# Altium schematic sheet MSP-LITO-MSPM0L2228.SchDoc: MSPM0G3507
size 431 x 279 mm; Date: Not shown in title block; ApprovedBy: Not shown in title block; CheckedBy: Not shown in title block; Author: Not shown in title block; CompanyName: Not shown in title block; DrawnBy: Johnson He; Engineer: Not shown in title block; Organization: Not shown in title block; Address1: Not shown in title block; Address2: Not shown in title block; Address3: Not shown in title block; Address4: Not shown in title block; DocumentNumber: 1; Revision: Use project parameter SCH_Rev; SheetNumber: 1; SheetTotal: 1; PageSetup: Record=PageOptions|CenterHorizontal=True|CenterVertical=True|PrintScale=1.00|XCorrection=1.00|YCorrection=1.00|PrintKind=0|BorderSize=5000000|LeftOffset=0|BottomOffset=0|Orientation=2|PaperLength=1000|PaperWidth=1000|Scale=100|PaperSource=15|PrintQuality=600|MediaType=1|DitherType=10|PaperKind=Letter|PrintScaleMode=1; CurrentTime: Not shown in title block; CurrentDate: Not shown in title block; Time: Not shown in title block; DocumentFullPathAndName: Not shown in title block; DocumentName: Not shown in title block; ModifiedDate: Not shown in title block; ImagePath: Not shown in title block
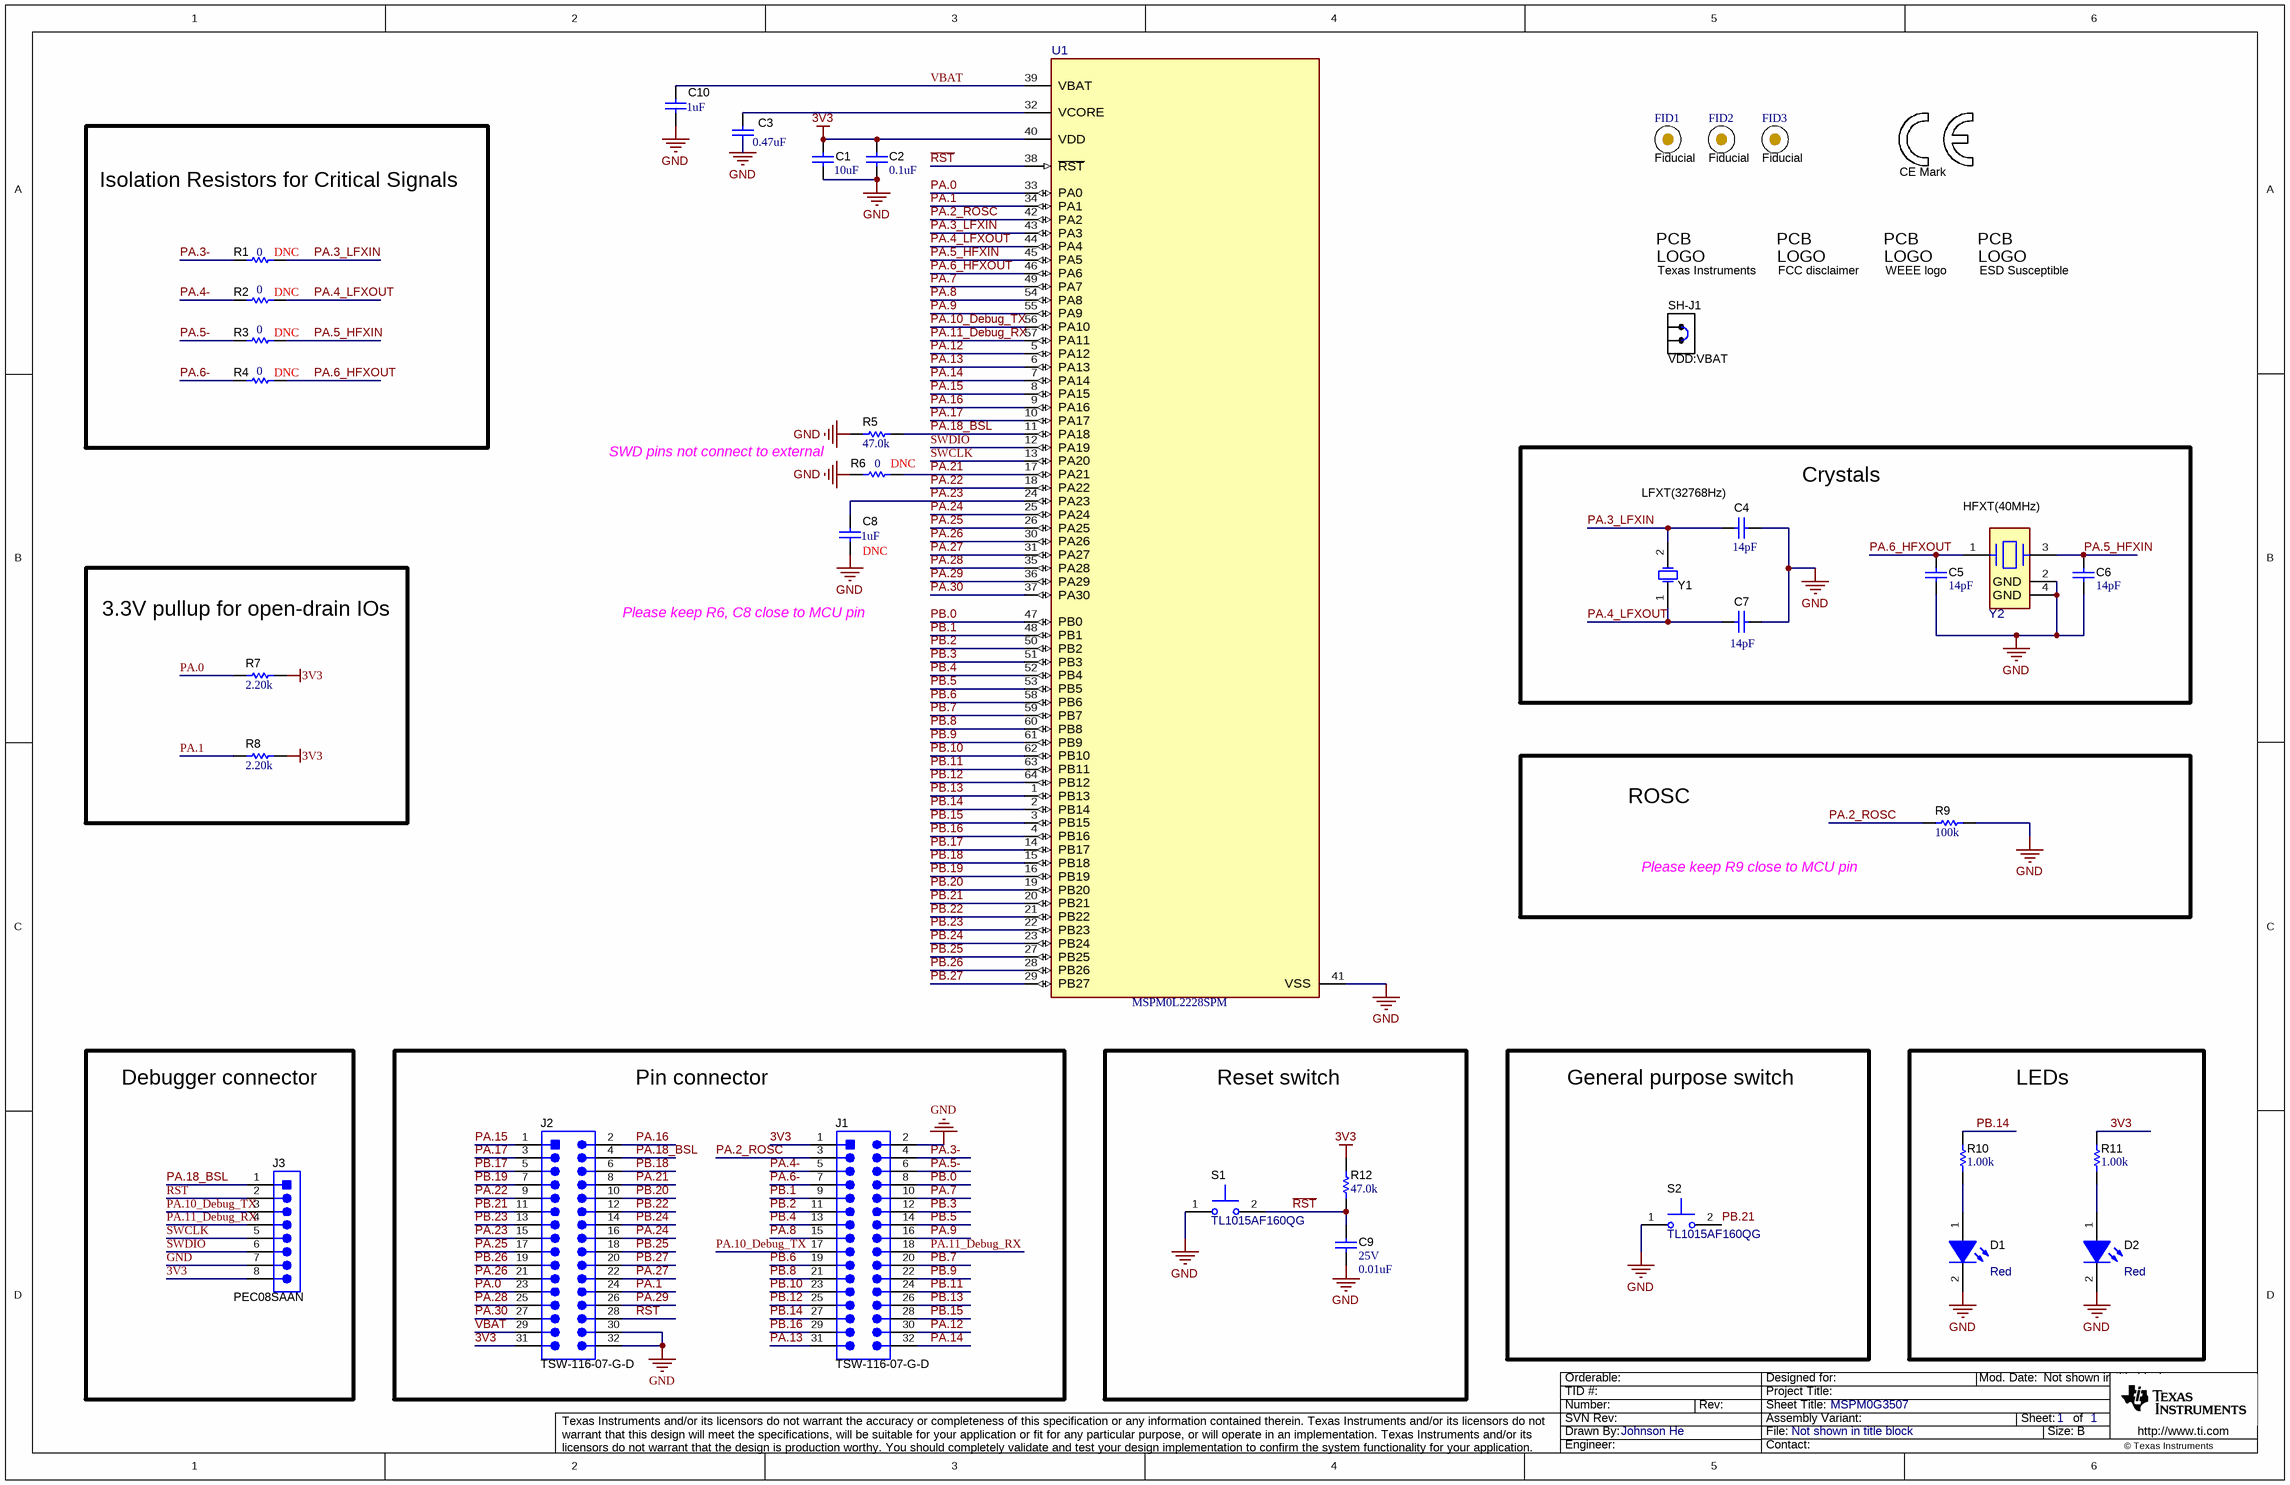
[diagram p0: MSP-LITO-MSPM0L2228.SchDoc]

## Parts
C1  ValueDisplayed: 10uF  [0603]  (hidden comment: GRM188R60J106ME84)
C2  ValueDisplayed: 0.1uF  [0402]  (hidden comment: GRM155R61H104ME14D)
C3  ValueDisplayed: 0.47uF  [0402]  (hidden comment: GRM155R60J474KE19D)
C4  ValueDisplayed: 14pF  [0402]  (hidden comment: GCQ1555C1H140JB01D)
C5  ValueDisplayed: 14pF  [0402]  (hidden comment: GCQ1555C1H140JB01D)
C6  ValueDisplayed: 14pF  [0402]  (hidden comment: GCQ1555C1H140JB01D)
C7  ValueDisplayed: 14pF  [0402]  (hidden comment: GCQ1555C1H140JB01D)
C8  value 1uF  ValueDisplayed: DNC  [0402]  (hidden comment: GRM155R61E105KA12D)
C9  VDC_V: 25V  ValueDisplayed: 0.01uF  [0402]  (hidden comment: GRM155R71E103KA01D)
C10  value 1uF  [0402]  (hidden comment: GRM155R61E105KA12D)
D1  value Red  [LED_SMLD12_RED]  (hidden comment: SML-D12U1WT86)
D2  value Red  [LED_SMLD12_RED]  (hidden comment: SML-D12U1WT86)
FID1  Fiducial  [Fiducial10-20]
FID2  Fiducial  [Fiducial10-20]
FID3  Fiducial  [Fiducial10-20]
J1  TSW-116-07-G-D  [TSW-116-07-G-D]
J2  TSW-116-07-G-D  [TSW-116-07-G-D]
J3  PEC08SAAN  [SULLINS_PEC08SAAN]
Logo1  CE Mark  [CE_Mark_5mm]  (no BOM)
Logo2  Texas Instruments  [TI_Stacked_Overlay_Small]  (no BOM)
Logo3  FCC disclaimer  [FCC_disclaimer]  (no BOM)
Logo4  WEEE logo  [WEEE_Minimum]  (no BOM)
Logo5  ESD Susceptible  [ESD_Overlay_Large]  (no BOM)
R1  value 0  ValueDisplayed: DNC  [0402]  (hidden comment: RC0402JR-070RL)  (no BOM)
R2  value 0  ValueDisplayed: DNC  [0402]  (hidden comment: RC0402JR-070RL)  (no BOM)
R3  value 0  ValueDisplayed: DNC  [0402]  (hidden comment: RC0402JR-070RL)  (no BOM)
R4  value 0  ValueDisplayed: DNC  [0402]  (hidden comment: RC0402JR-070RL)  (no BOM)
R5  ValueDisplayed: 47.0k  [0402]  (hidden comment: RC0402FR-0747KL)
R6  value 0  ValueDisplayed: DNC  [0402]  (hidden comment: RC0402JR-070RL)  (no BOM)
R7  ValueDisplayed: 2.20k  [0402]  (hidden comment: RC0402FR-072K2L)
R8  ValueDisplayed: 2.20k  [0402]  (hidden comment: RC0402FR-072K2L)
R9  ValueDisplayed: 100k  [0402]  (hidden comment: RG1005P-104-B-T5)
R10  ValueDisplayed: 1.00k  [0402]  (hidden comment: RC0402FR-071KL)
R11  ValueDisplayed: 1.00k  [0402]  (hidden comment: RC0402FR-071KL)
R12  ValueDisplayed: 47.0k  [0402]  (hidden comment: RC0402FR-0747KL)
S1  TL1015AF160QG  [SW_TL1015AF160QG]
S2  TL1015AF160QG  [SW_TL1015AF160QG]
SH-J1  value VDD:VBAT  [SNT-100-BK-G]  (hidden comment: SNT-100-BK-G)
U1  MSPM0L2228SPM  [PM0064A-MFG]
Y1  X1A0001410014  [Epson_FC-135]  (value not drawn)
Y2  X1E0000210179  [FP-X1E0000210179_TSX-3225-MFG]  (value not drawn)

## Blocks framed on the sheet
Isolation Resistors for Critical Signals: R1-R4
Crystals: C4-C7 Y1 Y2
3.3V pullup for open-drain IOs: R7 R8
ROSC: R9
Debugger connector: J3
Pin connector: J1 J2
Reset switch: C9 R12 S1
General purpose switch: S2
LEDs: D1 D2 R10 R11

## Nets
3V3: C1.1 C2.1 J1.1 J2.31 J3.8 R7.2 R8.2 R11.2 R12.2 U1.40(VDD)
GND: C1.2 C2.2 C3.2 C4.1 C5.2 C6.2 C7.1 C8.2 C9.2 C10.2 D1.2(K) D2.2(K) J1.2 J2.30 J2.32 J3.7 R5.2 R6.1 R9.2 S1.1 S2.1 U1.41(VSS) Y2.2(GND) Y2.4(GND)
PA.0: J2.23 R7.1 U1.33(PA0)
PA.1: J2.24 R8.1 U1.34(PA1)
PA.2_ROSC: J1.3 R9.1 U1.42(PA2)
PA.3-: J1.4 R1.1
PA.3_LFXIN: C4.2 R1.2 U1.43(PA3) Y1.2(OSC2)
PA.4-: J1.5 R2.1
PA.4_LFXOUT: C7.2 R2.2 U1.44(PA4) Y1.1(OSC1)
PA.5-: J1.6 R3.1
PA.5_HFXIN: C6.1 R3.2 U1.45(PA5) Y2.3
PA.6-: J1.7 R4.1
PA.6_HFXOUT: C5.1 R4.2 U1.46(PA6) Y2.1
PA.7: J1.10 U1.49(PA7)
PA.8: J1.15 U1.54(PA8)
PA.9: J1.16 U1.55(PA9)
PA.10_Debug_TX: J1.17 J3.3 U1.56(PA10)
PA.11_Debug_RX: J1.18 J3.4 U1.57(PA11)
PA.12: J1.30 U1.5(PA12)
PA.13: J1.31 U1.6(PA13)
PA.14: J1.32 U1.7(PA14)
PA.15: J2.1 U1.8(PA15)
PA.16: J2.2 U1.9(PA16)
PA.17: J2.3 U1.10(PA17)
PA.18_BSL: J2.4 J3.1 R5.1 U1.11(PA18)
PA.21: J2.8 R6.2 U1.17(PA21)
PA.22: J2.9 U1.18(PA22)
PA.23: C8.1 J2.15 U1.24(PA23)
PA.24: J2.16 U1.25(PA24)
PA.25: J2.17 U1.26(PA25)
PA.26: J2.21 U1.30(PA26)
PA.27: J2.22 U1.31(PA27)
PA.28: J2.25 U1.35(PA28)
PA.29: J2.26 U1.36(PA29)
PA.30: J2.27 U1.37(PA30)
PB.0: J1.8 U1.47(PB0)
PB.1: J1.9 U1.48(PB1)
PB.2: J1.11 U1.50(PB2)
PB.3: J1.12 U1.51(PB3)
PB.4: J1.13 U1.52(PB4)
PB.5: J1.14 U1.53(PB5)
PB.6: J1.19 U1.58(PB6)
PB.7: J1.20 U1.59(PB7)
PB.8: J1.21 U1.60(PB8)
PB.9: J1.22 U1.61(PB9)
PB.10: J1.23 U1.62(PB10)
PB.11: J1.24 U1.63(PB11)
PB.12: J1.25 U1.64(PB12)
PB.13: J1.26 U1.1(PB13)
PB.14: J1.27 R10.2 U1.2(PB14)
PB.15: J1.28 U1.3(PB15)
PB.16: J1.29 U1.4(PB16)
PB.17: J2.5 U1.14(PB17)
PB.18: J2.6 U1.15(PB18)
PB.19: J2.7 U1.16(PB19)
PB.20: J2.10 U1.19(PB20)
PB.21: J2.11 S2.2 U1.20(PB21)
PB.22: J2.12 U1.21(PB22)
PB.23: J2.13 U1.22(PB23)
PB.24: J2.14 U1.23(PB24)
PB.25: J2.18 U1.27(PB25)
PB.26: J2.19 U1.28(PB26)
PB.27: J2.20 U1.29(PB27)
~{RST}: C9.1 J2.28 J3.2 R12.1 S1.2 U1.38(~{RST})
SWCLK: J3.5 U1.13(PA20)
SWDIO: J3.6 U1.12(PA19)
VBAT: C10.1 J2.29 U1.39(VBAT)
NetC3_1: C3.1 U1.32(VCORE)
NetD1_1: D1.1(A) R10.1
NetD2_1: D2.1(A) R11.1

## Notes on the sheet
- SWD pins not connect to external
- (near C4) LFXT(32768Hz)
- HFXT(40MHz)
- Please keep R6, C8 close to MCU pin
- Please keep R9 close to MCU pin
- Drawn By:
- SVN Rev:
- Number:
- TID #:
- Orderable:
- Rev:
- Sheet Title:
- File:
- Project Title:
- Designed for:
- Assembly Variant:
- Mod. Date:
- Sheet:
- Size:
- of
- B
- http://www.ti.com
- Texas Instruments and/or its licensors do not warrant the accuracy or completeness of this specification or any information contained therein. Texas Instruments and/or its licensors do not warrant that this design will meet the specifications, will be suitable for your application or fit for any particular purpose, or will operate in an implementation. Texas Instruments and/or its licensors do not warrant that the design is production worthy. You should completely validate and test your design implementation to confirm the system functionality for your application.
- Engineer:
- Contact:
- © Texas Instruments
- (in symbol CMP-0074769-4) PCB; LOGO
- (in symbol CMP-0074838-1) PCB; LOGO
- (in symbol CMP-0074840-1) PCB; LOGO
- (in symbol CMP-0074847-1) PCB; LOGO

## Library data of the parts
C1 = CMP-0007304-5: CAP, CERM, 10 uF, 6.3 V, +/- 20%, X5R, 0603; Manufacturer: MuRata; TaMin_C: -55°C; Polarized: N; SizeAreaWB_mm2: 4.68; Value1: Unknown; U/M: EA; Value: 10uF; TaMax_C: 85°C; SizeZ_mm: 1; SizeX_mm: 1.6; SizeY_mm: 0.8; Value2: 6.3V; SizeArea_mm2: 1.28; Cap_F: 10µF; AEC Category: Q200; Publisher: Texas Instruments; TempCo: X5R; Published: 2008-06-19; RoHS: Y; MountType: SMT; Supplier 1: Digi-Key; PackageReference: 0603; Tolerance_%: 20%; Cap_Case: 0603; CompType: Capacitor; LatestRevisionDate: 2017-03-09; PartNumber: GRM188R60J106ME84; AEC Qualified: ?; VDC_V: 6.3V; ComponentLink1Description: Datasheet link; Supplier Part Number 1: 490-7316-1-ND; Technology: Ceramic; ComponentLink1URL: http://search.murata.co.jp/Ceramy/image/img/A01X/G101/ENG/GRM188R60J106ME84-01.pdf
C2 = CMP-0006614-2: CAP, CERM, 0.1 uF, 50 V, +/- 20%, X5R, 0402; Manufacturer: MuRata; TaMin_C: -55°C; Polarized: N; SizeAreaWB_mm2: 3; Value1: Unknown; U/M: EA; Value: 0.1uF; TaMax_C: 85°C; SizeZ_mm: 0.6; SizeX_mm: 1; SizeY_mm: 0.5; Value2: 50V; Cap_F: 100nF; AEC Category: Q200; Supplier Part Number 2: 81-GRM155R61H104ME4D; Publisher: Texas Instruments; Supplier 2: Mouser; TempCo: X5R; Published: 2008-06-19; RoHS: Y; MountType: SMT; Supplier 1: Digi-Key; PackageReference: 0402; Tolerance_%: 20%; Cap_Case: 0402; SizeArea_mm2: 0.5; CompType: Capacitor; LatestRevisionDate: 2017-03-09; PartNumber: GRM155R61H104ME14D; AEC Qualified: N; VDC_V: 50V; ComponentLink1Description: Datasheet link; AEC Grade: N/A; Supplier Part Number 1: GRM155R61H104ME14D-ND; Technology: Ceramic; ComponentLink1URL: http://search.murata.co.jp/Ceramy/image/img/A01X/G101/ENG/GRM155R61H104ME14-01.pdf
C3 = CMP-0006551-2: CAP, CERM, 0.47 uF, 6.3 V, +/- 10%, X5R, 0402; Manufacturer: MuRata; TaMin_C: -55°C; Polarized: N; SizeAreaWB_mm2: 3; Value1: Unknown; U/M: EA; Value: 0.47uF; TaMax_C: 85°C; SizeZ_mm: 0.6; SizeX_mm: 1; SizeY_mm: 0.5; Value2: 6.3V; Cap_F: 470nF; AEC Category: Q200; Supplier Part Number 2: 38K1645; Publisher: Texas Instruments; Supplier 2: Newark; Supplier Part Number 3: 81-GRM155R60J474KE9D; TempCo: X5R; Supplier 3: Mouser; Published: 2008-06-19; RoHS: Y; MountType: SMT; Supplier 1: Digi-Key; PackageReference: 0402; Tolerance_%: 10%; Cap_Case: 0402; SizeArea_mm2: 0.5; CompType: Capacitor; LatestRevisionDate: 2017-03-09; PartNumber: GRM155R60J474KE19D; AEC Qualified: ?; VDC_V: 6.3V; ComponentLink1Description: Datasheet link; Supplier Part Number 1: 490-3266-1-ND; Technology: Ceramic; ComponentLink1URL: http://search.murata.co.jp/Ceramy/PnsearchViewAction.do?HnOFG=ON&HnNFG=ON&SEL_CNT=50&sLang=en&sKey=GRM155R60J474KE19D&x=9&y=9&search=startwith
C4-C7 = CMP-0860834-1: CAP, CERM, 14 pF, 50 V,+/- 5%, C0G/NP0, AEC-Q200 Grade 1, 0402; Manufacturer: MuRata; Value: 14pF; Polarized: N; SizeZ_mm: 0.6; SizeX_mm: 1; AEC Category: Q200; SizeAreaWB_mm2: 3; TaMin_C: -55°C; TaMax_C: 125°C; U/M: EA; SizeArea_mm2: 0.5; Value2: 50V; AEC Qualified: Y; RoHS: Y; ComponentLink1URL: https://search.murata.co.jp/Ceramy/image/img/A01X/G101/ENG/GCQ1555C1H140JB01-01.pdf; Technology: Ceramic; Cap_F: 14pF; ComponentLink1Description: Datasheet link; MountType: SMT; PartNumber: GCQ1555C1H140JB01D; Tolerance_%: 5%; TempCo: C0G/NP0; AEC Grade: 1; PackageReference: 0402; Cap_Case: 0402; SizeY_mm: 0.5; VDC_V: 50V; CompType: Capacitor
C8 C10 = CMP-0006608-2: CAP, CERM, 1 uF, 25 V, +/- 10%, X5R, 0402; Manufacturer: MuRata; TaMin_C: -55°C; Polarized: N; SizeAreaWB_mm2: 3; Value1: Unknown; U/M: EA; TaMax_C: 85°C; SizeZ_mm: 0.6; SizeX_mm: 1; SizeY_mm: 0.5; Value2: 25V; Cap_F: 1µF; AEC Category: Q200; Supplier Part Number 2: 48W5730; Publisher: Texas Instruments; Supplier 2: Newark; Supplier Part Number 3: 81-GRM155R61E105KA2D; TempCo: X5R; Supplier 3: Mouser; Published: 2008-06-19; RoHS: Y; MountType: SMT; Supplier 1: Digi-Key; PackageReference: 0402; Tolerance_%: 10%; Cap_Case: 0402; SizeArea_mm2: 0.5; CompType: Capacitor; LatestRevisionDate: 2017-03-09; PartNumber: GRM155R61E105KA12D; AEC Qualified: ?; VDC_V: 25V; ComponentLink1Description: Datasheet link; Supplier Part Number 1: 490-10017-1-ND; Technology: Ceramic; ComponentLink1URL: http://psearch.murata.com/capacitor/product/GRM155R61E105KA12%23.pdf
C9 = CMP-0006658-2: CAP, CERM, 0.01 uF, 25 V, +/- 10%, X7R, 0402; Manufacturer: MuRata; TaMin_C: -55°C; Polarized: N; SizeAreaWB_mm2: 3; Value1: Unknown; U/M: EA; Value: 0.01uF; TaMax_C: 125°C; SizeZ_mm: 0.6; SizeX_mm: 1; SizeY_mm: 0.5; Cap_F: 10nF; AEC Category: Q200; Supplier Part Number 2: 81-GRM36X103K25; Publisher: Texas Instruments; Supplier 2: Mouser; Supplier Part Number 3: 8819734; TempCo: X7R; Supplier 3: Farnell; Published: 2008-06-19; RoHS: Y; MountType: SMT; Supplier 1: Digi-Key; PackageReference: 0402; Tolerance_%: 10%; Cap_Case: 0402; Value2: 25V; SizeArea_mm2: 0.5; CompType: Capacitor; LatestRevisionDate: 2017-03-09; PartNumber: GRM155R71E103KA01D; AEC Qualified: ?; ComponentLink1Description: Datasheet link; Supplier Part Number 1: 490-1312-1-ND; Technology: Ceramic; ComponentLink1URL: http://search.murata.co.jp/Ceramy/PnsearchViewAction.do?HnOFG=ON&HnNFG=ON&SEL_CNT=50&sLang=en&sKey=GRM155R71E103KA01D&x=9&y=9&search=startwith
D1 D2 = CMP-0086209-1: LED, Red, SMD; Manufacturer: Rohm; Vr_V: 5V; SizeX_mm: 1.6; Value2: 2.2V; SizeY_mm: 0.8; Io_A: 20mA; Ir_A: 10mA; SizeArea_mm2: 1.28; SizeZ_mm: 0.65; SizeAreaWB_mm2: 4.68; Value1: 0.054W; Power_TotalModule: 54mW; RoHS: Y; ComponentLink1URL: https://www.rohm.com/datasheet/SML-D12U1W; Type: ?; PackageReference: 1.6x0.8mm; PartNumber: SML-D12U1WT86; MountType: SMT; Color: Red; ComponentLink1Description: Datasheet link; CompType: LED; Vf_V: 2.2V
FID1-FID3 = CMP-0077181-1: Fiducial mark.  There is nothing to buy or mount.; CompType: Fiducial; PackageReference: N/A; Library Reference: Fiducial; ClassName: FiducialMark; Manufacturer: N/A; MountType: N/A; PartNumber: N/A
J1 J2 = CMP-0075429-1: Header, 100mil, 16x2, Gold, TH; Manufacturer: Samtec; Pitch_mm: 2.54; Cert_VDE: N; Gender: Male; Cert_CSA: Y; Voltage_V: 550V; Green_REACh: Passed; Current_A: 6.3A; CT: False; Green_Lifecycle: Active; Row_Count: 2; CNHeader: True; ComponentLink1Description: Datasheet URL; RoHS: Y; Supplier 1: Digi-Key; Cert_UL: Y; Orientation: Vertical; Green_EU RoHS: Passed; PackageReference: 16x2 Header; Color: Black; PartNumber: TSW-116-07-G-D; PinCount: 32; Publisher: Texas Instruments; ContactFinish: Gold; Cert_CULUS: N; Shrouded: N; ClassName: Header; RowSpacing_mm: 2.54; ComponentLink1URL: http://samtec.com/ftppub/pdf/TSW_TH.PDF; LatestRevisionDate: 2017-07-12; CompType: Header; MountType: TH; Supplier Part Number 1: SAM1028-16-ND; Green_EU RoHS-2: Passed
J3 = CMP-0054563-1: Header, 100mil, 8x1, Tin, TH; Manufacturer: Sullins Connector Solutions; CNHeader: TRUE; Current_A: 3A; Green_Lifecycle: Not Set; Shrouded: N; Gender: Male; Green_REACh: Incomplete; Voltage_V: 1.8kV; Row_Count: 1; Pitch_mm: 2.54; CT: FALSE; Cert_UL: Y; ComponentLink1URL: http://www.sullinscorp.com/catalogs/77_PAGE108-109_.100_MALE_HDR.pdf; ClassName: Header; Publisher: Texas Instruments; Color: Black; RoHS: Y; MountType: TH; Green_EU RoHS-2: Incomplete; Supplier 1: Digi-Key; Green_EU RoHS: Incomplete; PackageReference: Header, 8x1, 100mil, TH; PinCount: 8; CompType: Header; LatestRevisionDate: 26/05/2017; PartNumber: PEC08SAAN; Orientation: Vertical; ComponentLink1Description: Datasheet URL; Supplier Part Number 1: S1012E-08-ND; ContactFinish: Tin
Logo1 = CMP-0074844-2: Manufacturer: Texas Instruments; SymbolCreator: a0412235; AEC Category: Q200; CompType: IC; Published: 2009-03-03; Publisher: Texas Instruments; LatestRevisionDate: 2017-07-06; Lib Reference: CE Mark; PartNumber: CE Mark; Library Reference: CE Mark; ComponentLink1Description: Datasheet Link; ComponentLink1URL: http://www.ti.com/lit/ds/symlink/GPN.pdf; ComponentLink2Description: Product Folder; ComponentLink2URL: http://www.ti.com/product/GPN; ComponentLink3Description: Online Datasheet; ComponentLink3URL: http://www.ti.com/product/GPN/datasheet
Logo2 = CMP-0074838-1: Texas Instrument Corporate Signature; SymbolCreator: a0412235; Lib Reference: TI_Logo; Library Reference: Logo; SymbolVersion: 2011-08-22; Published: 2009-03-03; Publisher: Texas Instruments; ClassName: Logo; LatestRevisionDate: 2017-07-06; PartNumber: Texas Instruments
Logo3 = CMP-0074847-1: FCC_disclaimer; Library Reference: Logo; Published: 2009-03-03; Publisher: Texas Instruments; LatestRevisionDate: 2017-07-06; Lib Reference: FCC_disclaimer; PartNumber: FCC disclaimer
Logo4 = CMP-0074769-4: Manufacturer: Texas Instruments; CompType: IC; AEC Category: Q200; Library Reference: WEEE logo; Lib Reference: WEEE logo; PartNumber: WEEE logo; ComponentLink2URL: http://www.ti.com/product/GPN; ComponentLink1URL: http://www.ti.com/lit/ds/symlink/GPN.pdf; ComponentLink3URL: http://www.ti.com/product/GPN/datasheet; ComponentLink1Description: Datasheet Link; ComponentLink3Description: Online Datasheet; ComponentLink2Description: Product Folder
Logo5 = CMP-0074840-1: ESD Susceptible Symbol; SymbolCreator: a0412235; Lib Reference: ESD_Susceptible; Library Reference: Logo; Publisher: Texas Instruments; SymbolVersion: 2011-08-22; Published: 2009-03-03; LatestRevisionDate: 2017-07-06; PartNumber: ESD Susceptible
R1-R4 R6 = CMP-0027004-2: RES, 0, 5%, 0.063 W, 0402; Manufacturer: Yageo America; Power_W: 63mW; TempCo: 200 ppm/C; Value_Code: 0000; U/M: EA; EIA_Code: E24; SizeX_mm: 1; SizeY_mm: 0.5; SizeZ_mm: 0.6; Value2: 0.063W; VDC_V: 50V; AEC Category: Q200; Supplier Part Number 2: 603-RC0402JR-070RL; Publisher: Texas Instruments; Supplier 2: Mouser; Supplier Part Number 3: 9232516; Supplier 3: Farnell; Published: 2008-06-26; RoHS: Y; Value1: 5%; MountType: SMT; Supplier 1: Digi-Key; PackageReference: 0402; Tolerance_%: 5%; Res_ohm: 0; SizeArea_mm2: 0.5; CompType: Resistor; LatestRevisionDate: 2017-03-09; PartNumber: RC0402JR-070RL; AEC Qualified: ?; ComponentLink1Description: Datasheet link; Supplier Part Number 1: 311-0.0JRCT-ND; Technology: Thick Film; ComponentLink1URL: http://www.yageo.com/pdf/Pu-RC0402_51_PbFree_L_2.pdf
R5 R12 = CMP-0026737-1: RES, 47.0 k, 1%, 0.0625 W, 0402; Manufacturer: Yageo America; Power_W: 62.5mW; TempCo: 100 ppm/C; Value_Code: 47k0; U/M: EA; Value: 47.0k; Res_ohm: 47k; SizeX_mm: 1; SizeY_mm: 0.5; SizeZ_mm: 0.6; AEC Qualified: N; VDC_V: 50V; AEC Category: Q200; ComponentLink1URL: http://www.yageo.com/documents/recent/PYu-RC0402_51_RoHS_L_6_r.pdf; Supplier Part Number 2: 67R9937; Publisher: Texas Instruments; Supplier 2: Newark; Supplier Part Number 3: 603-RC0402FR-0747KL; Supplier 3: Mouser; Published: 2008-06-26; RoHS: Y; Value1: 1%; MountType: SMT; Supplier 1: Digi-Key; PackageReference: 0402; Tolerance_%: 1%; Value2: 0.0625W; SizeArea_mm2: 0.5; CompType: Resistor; LatestRevisionDate: 2017-03-09; PartNumber: RC0402FR-0747KL; ComponentLink1Description: Datasheet link; AEC Grade: N/A; Supplier Part Number 1: 311-47.0KLRCT-ND; Technology: Thick Film
R7 R8 = CMP-0026729-1: RES, 2.20 k, 1%, 0.063 W, 0402; Manufacturer: Yageo America; Power_W: 63mW; TempCo: 100 ppm/C; Value_Code: 2k20; U/M: EA; Value: 2.20k; Res_ohm: 2.2k; SizeX_mm: 1; SizeY_mm: 0.5; SizeZ_mm: 0.6; Value2: 0.063W; AEC Qualified: N; AEC Category: Q200; ComponentLink1URL: http://www.yageo.com/documents/recent/PYu-RC_Group_51_RoHS_L_1.pdf; Supplier Part Number 2: 67R9903; Publisher: Texas Instruments; Supplier 2: Newark; Supplier Part Number 3: 603-RC0402FR-072K2L; Supplier 3: Mouser; Published: 2008-06-26; RoHS: Y; Value1: 1%; MountType: SMT; Supplier 1: Digi-Key; PackageReference: 0402; Tolerance_%: 1%; SizeArea_mm2: 0.5; CompType: Resistor; LatestRevisionDate: 2017-03-09; PartNumber: RC0402FR-072K2L; ComponentLink1Description: Datasheet link; AEC Grade: N/A; Supplier Part Number 1: 311-2.20KLRCT-ND; Technology: Thick Film
R9 = CMP-0026815-1: RES, 100 k, 0.1%, 0.063 W, 0402; Manufacturer: Susumu Co Ltd; Power_W: 63mW; TempCo: 25 ppm/C; U/M: EA; Value: 100k; EIA_Code: E192; SizeX_mm: 1; SizeY_mm: 0.5; SizeZ_mm: 0.6; Value2: 0.063W; AEC Category: Q200; ComponentLink1URL: http://www.susumu-usa.com/pdf/RG_Data_Sheet.pdf; Supplier Part Number 2: 85K1460; Publisher: Texas Instruments; Supplier 2: Newark; Supplier Part Number 3: 754-RG1005P-104-B-T5; Supplier 3: Mouser; Published: 2008-06-26; Value_Code: 100k; RoHS: Y; Value1: 0.1%; MountType: SMT; Supplier 1: Digi-Key; PackageReference: 0402; Tolerance_%: 0.1%; Res_ohm: 100k; SizeArea_mm2: 0.5; CompType: Resistor; LatestRevisionDate: 2017-03-09; PartNumber: RG1005P-104-B-T5; AEC Qualified: ?; ComponentLink1Description: Datasheet link; Supplier Part Number 1: RG10P100KBCT-ND; Technology: Thin Film
R10 R11 = CMP-0026725-1: RES, 1.00 k, 1%, 0.0625 W, 0402; Manufacturer: Yageo America; Power_W: 62.5mW; TempCo: 100 ppm/C; Value_Code: 1k00; U/M: EA; Value: 1.00k; EIA_Code: E96; Res_ohm: 1k; SizeX_mm: 1; SizeY_mm: 0.5; SizeZ_mm: 0.6; AEC Qualified: N; VDC_V: 50V; AEC Category: Q200; ComponentLink1URL: http://www.yageo.com/NewPortal/yageodocoutput?fileName=/pdf/R-Chip/PYu-RC_Group_51_RoHS_L_4.pdf; Supplier Part Number 2: 98K7497; Publisher: Texas Instruments; Supplier 2: Newark; Supplier Part Number 3: 603-RC0402FR-071KL; Supplier 3: Mouser; Published: 2008-06-26; RoHS: Y; Value1: 1%; MountType: SMT; Supplier 1: Digi-Key; PackageReference: 0402; Tolerance_%: 1%; Value2: 0.0625W; SizeArea_mm2: 0.5; CompType: Resistor; LatestRevisionDate: 2017-03-09; PartNumber: RC0402FR-071KL; ComponentLink1Description: Datasheet link; AEC Grade: N/A; Supplier Part Number 1: 311-1.00KLRCT-ND; Technology: Thick Film
S1 S2 = CMP-0002143-3: Switch, Tactile, SPST-NO, 0.05A, 12V, SMT; Manufacturer: E-Switch; CurrentRating_mA: 50A; PositionCount: 1; SwitchFunction: Off-Mom; Supplier 2: Newark; Supplier 3: Mouser; Supplier 1: Digi-Key; Supplier Part Number 1: EG4344CT-ND; Supplier Part Number 2: 15N4458; Supplier Part Number 3: 612-TL1015AF; PartNumber: TL1015AF160QG; ComponentLink1Description: Datasheet URL; LatestRevisionDate: 2017-03-09; CompType: Switch; Publisher: Texas Instruments; Circuit: SPST-NO; VDC_V: 12V; RoHS: Y; Orientation: Top Actuated; PackageReference: Switch, 4.4x2x2.9 mm; MountType: SMT; ComponentLink1URL: http://spec.e-switch.com/P-J/P420000.pdf
SH-J1 = CMP-0003623-3: Shunt, 100mil, Gold plated, Black; Alternate PartNumber: 969102-0000-DA; Manufacturer: Samtec; Alternate Manufacturer: 3M; ComponentLink1URL: http://www.samtec.com/ftppub/pdf/SNT.PDF; Supplier 1: Digi-Key; CompType: Shunt; PackageReference: Shunt; ClassName: Shunt; RoHS: Y; Supplier Part Number 1: SAM8858-ND; MountType: N/A; PartNumber: SNT-100-BK-G; ComponentLink1Description: Datasheet Link
U1 = CMP-0121756-1: Mixed-Signal Microcontroller, LQFP64; Manufacturer: Texas Instruments; Number Of I2C Channels: 3; Frequency_Fixed: 32MHz; Number Of A/D Converters: 1; Number Of Pwm Channels: 18; Data Bus Width: 32bits; Standoff Height: 0.05mm; SizeZ_mm: 1.6mm; Number Of I/Os: 59; Number Of Spi Channels: 2; Memory Type: FLASH; Min Supply Voltage: 1.62V; Number Of Adc Channels: 26; Memory Size: 256KBytes; Number Of Uart Channels: 5; Number Of Timers/Counters: 6; Max Supply Voltage: 3.6V; Core Architecture: ARM Cortex-M0+; Interface: I2C,SPI,UART,LIN,IrDA,SMBus,Other; Ram Size: 32KBytes; AEC Qualified: No; PartNumber: MSPM0L2228SPM; Number Of Cores: 1; helpURL: https://upverter.com/upn/revision/e3d91dc85fdb9748/; Part Number: MSPM0L2228SPM; PackageReference: LQFP64; Datasheet Path: datasheets/IC-MSPM0L2228SPM.pdf; RoHS: UNKNOWN; Operating Temperature Range: -40°C to +125°C
Y1 = CMP-0004693-3: Crystal, 32.768 KHz, 12.5 pF, SMD; Manufacturer: Epson; TaMax_C: 85°C; TaMin_C: -40°C; CompType: Crystal; PackageReference: SMD, 2-Leads, Body 3.2x1.5mm; RoHS: Y; MountType: SMT; Frequency_Fixed: 32.768kHz; PartNumber: X1A0001410014; ComponentLink1Description: Datasheet Link; ComponentLink1URL: https://support.epson.biz/td/api/doc_check.php?dl=brief_FC-135R_en.pdf
Y2 = CMP-0098168-2: Crystal 40MHz ±10ppm (Tol) ±20ppm (Stability) 12pF FUND 40Ohm 4-Pin Mini-CSMD T/R; Manufacturer: Seiko Epson; SizeZ_mm: 0.6mm; AEC Qualified: No; Esr: 40; Frequency Stability: 20ppm; RoHS: TRUE; Frequency_Fixed: 40MHz; PackageReference: TSX-3225; PartNumber: X1E0000210179; ComponentLink1Description: Datasheet; ComponentLink1URL: https://support.epson.biz/td/api/doc_check.php?mode=dl&lang=en&Parts=X1E0000210179; datasheet: https://support.epson.biz/td/api/doc_check.php?mode=dl&lang=en&Parts=X1E0000210179; Datasheet Path: datasheets/Crys-X1E0000210179.pdf; Frequency Tolerance: 10ppm; helpURL: https://upverter.com/upn/revision/08d7803d4c2c7fb7/; Lead Free: Yes; Load Capacitance: 12pF; Operating Temperature Range: -40°C to +105°C; Part Number: X1E0000210179; Series: TSX-3225; Tolerance_%: 10ppm